# EAGLE design turns (EAGLE 7.7.0)

## Sheet 1 of 2
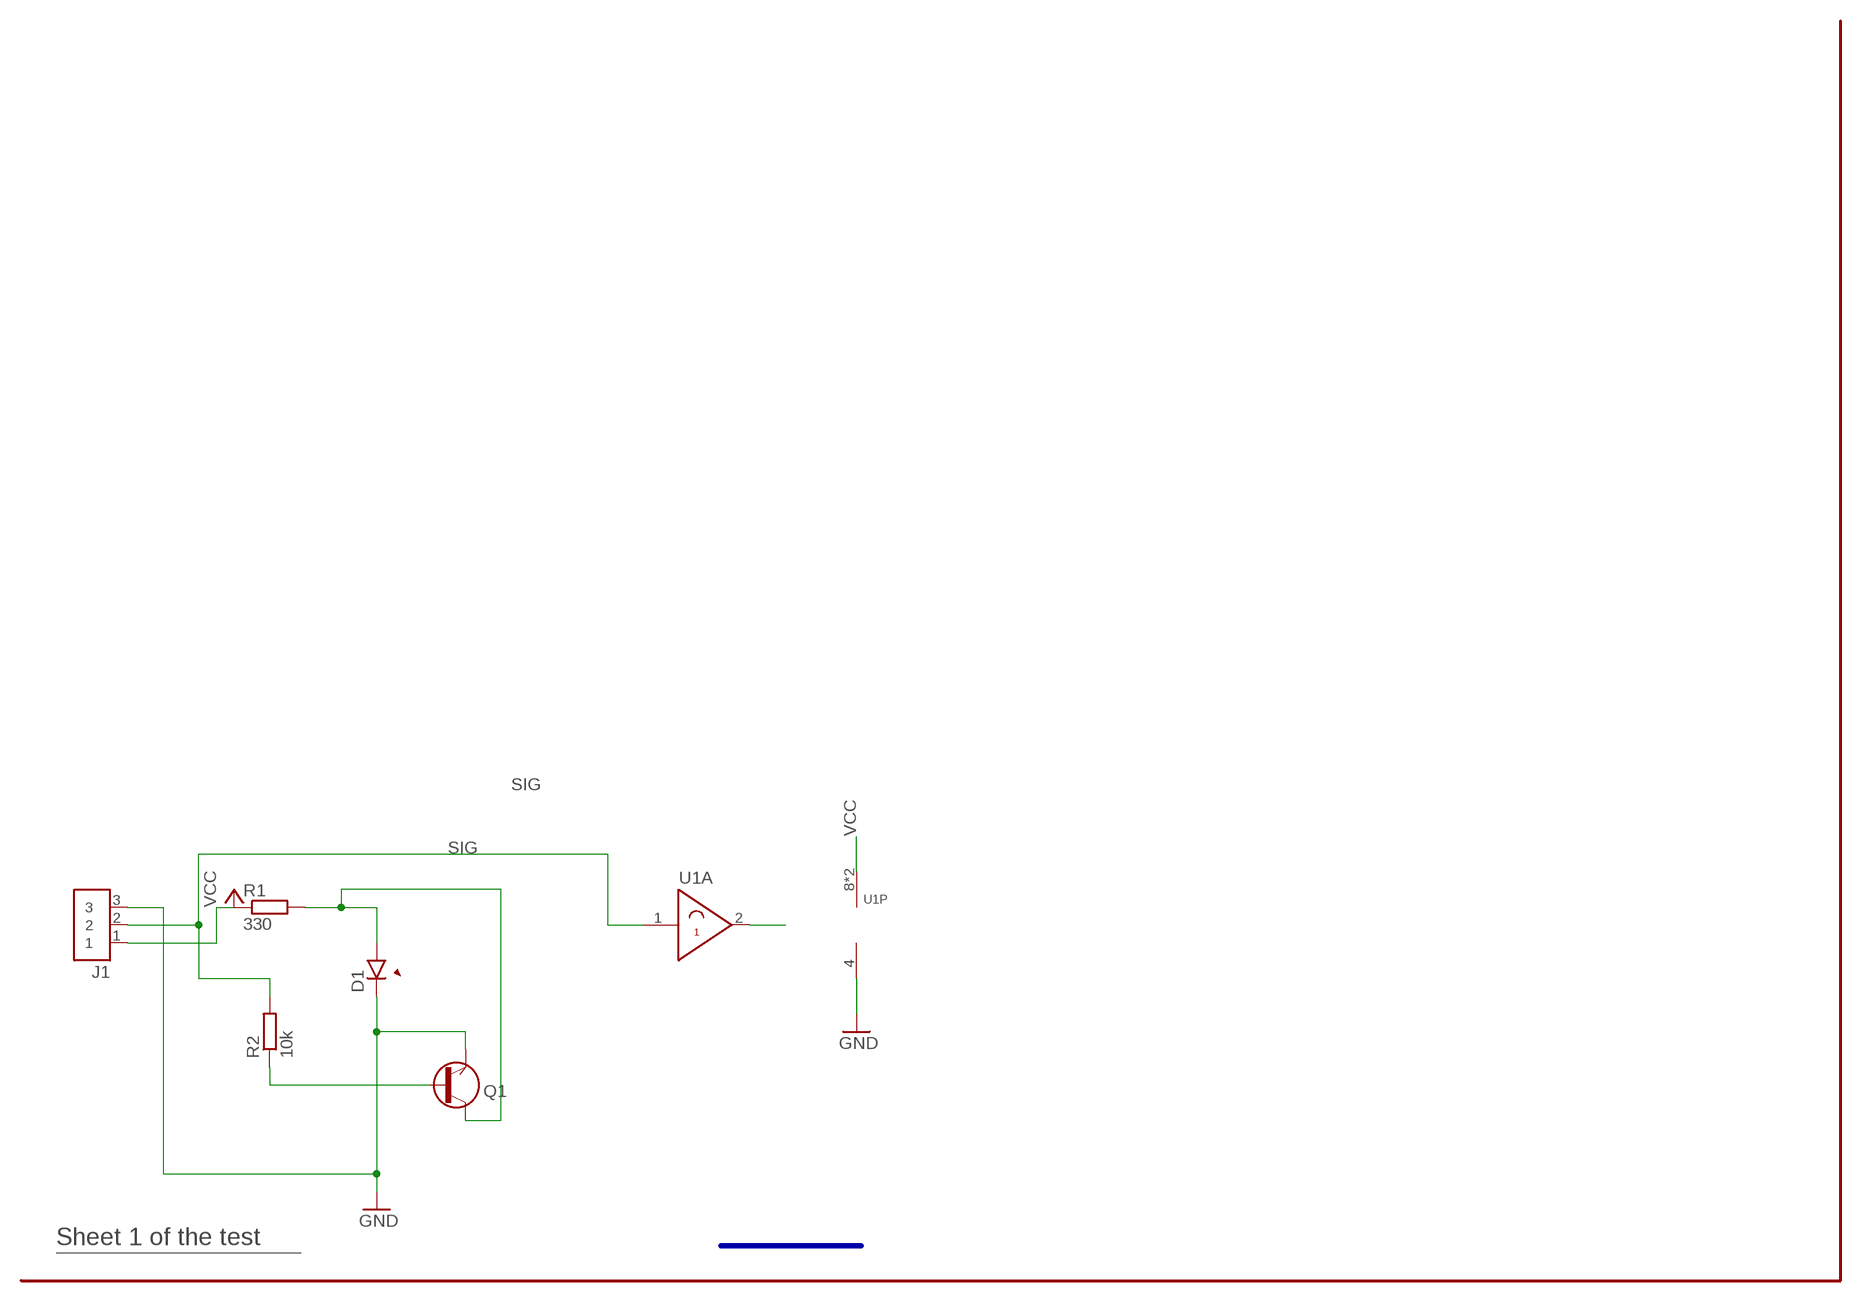
[diagram p0: schematic, sheet 1]

### Parts
D1  red  LED5MM  [LED5MM]
J1  HDR3  [HDR3]
Q1  NPN-BC817SOT23  [SOT23]
R1  330  R0805  [R0805]
R2  10k  R0805  [R0805]
U1  DUALBUFD  [SO8]

### Nets
GND [power]: D1.K(C) J1.3 Q1.2(E) U1.4(P:GND) ; also sheet 2
MID: U1.2(A:OUT) ; also sheet 2
N$1: D1.A Q1.3(C) R1.2
N$2: Q1.1(B) R2.1
SIG: J1.2 R2.2 U1.1(A:IN)
VCC [power]: J1.1 R1.1 U1.7(P:VCC) U1.8(P:VCC)

### Buses
B$1

### Notes on the sheet
- Sheet 1 of the test

## Sheet 2 of 2: Second half
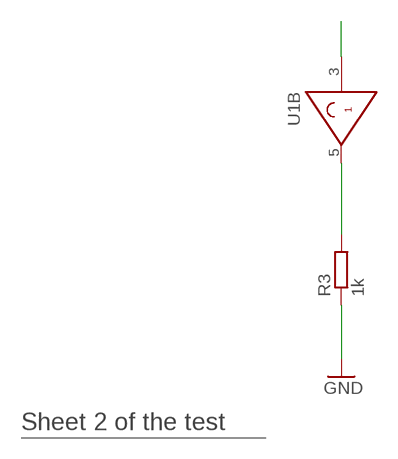
[diagram p1: schematic, sheet 2]

### Parts
R3  1k  R0805  [R0805]

### Nets
GND [power]: R3.1 ; also sheet 1
MID: U1.3(B:IN) ; also sheet 1
OUT: R3.2 U1.5(B:OUT)

### Notes on the sheet
- Sheet 2 of the test

## Library data of the parts
D1 = test:LED
J1 = test:HDR3
Q1 = test:NPN-*
R1-R3 = test:R: Resistor; MPN: RC0805FR-0710KL
U1 = test:DUALBUF: Two buffers in one package

## Net classes
0 default: width 0.254 mm
1 power: width 0.5 mm, drill 0.4 mm, clearance 0.3 mm

## Board
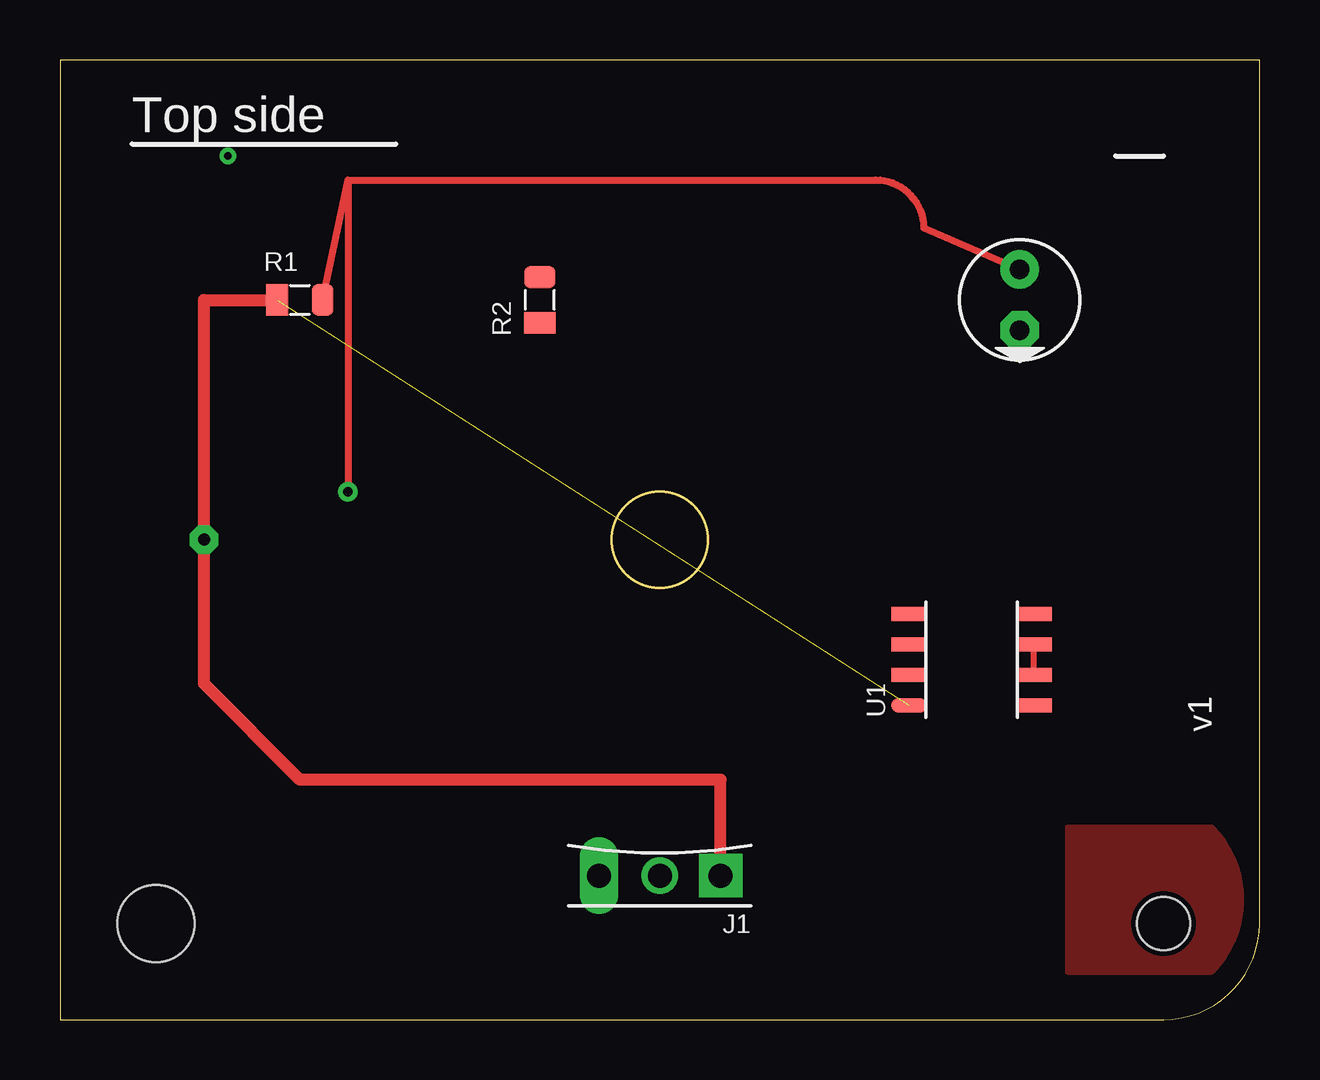
[diagram p2: board, top side]
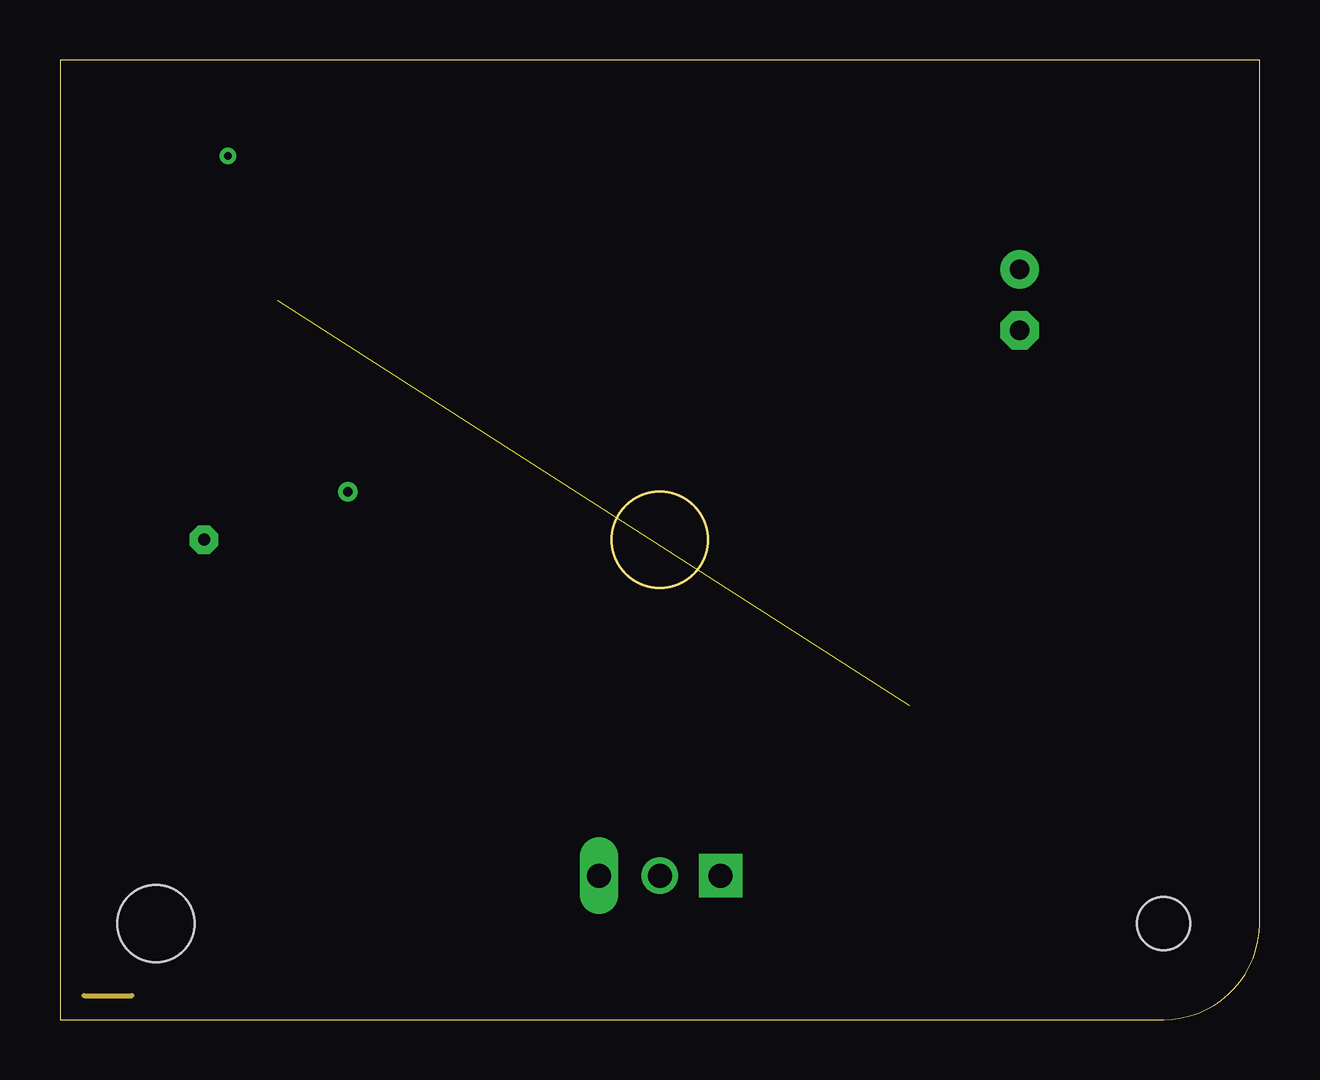
[diagram p3: board, inner layer 2]
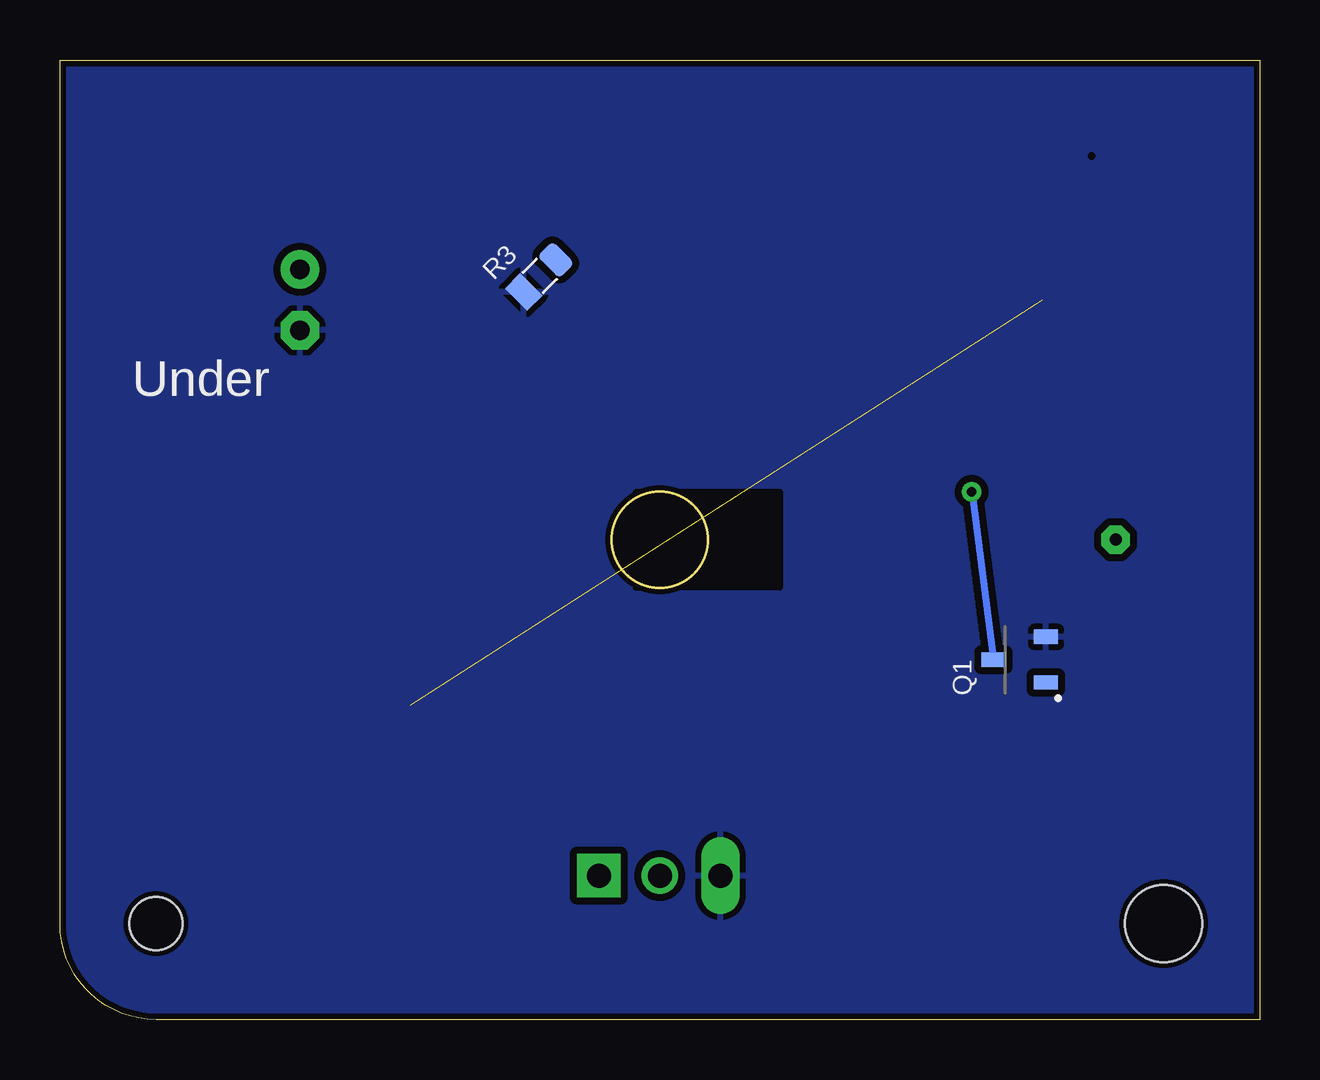
[diagram p4: board, bottom side, seen from below]

Size 50 x 40 mm. Coordinates in mm from the lower left corner, seen from the top.
Outline: 0,0 46,0 arc90 50,4 50,40 0,40 0,0
Outline: circle at 25,20 radius 2
Copper layers used: Top, layer 2, Bottom
Design rules "test": minimum track width 6mil, minimum drill 0.35mm, track to track 7mil, copper to edge 10mil, minimum pad ring 10mil, minimum via ring 8mil
Holes 2.2 mm at 46,4
layer 39: area 14,24 to 18,27
layer 41: area 30,2 to 36,6

### Footprints (pad centres in the part's own frame; a part is rotated, then mirrored left to right if it is on the bottom)
LED5MM = drill 0.8 pad 1.6: A -1.27,0 | drill 0.8 pad 1.6 octagon: K 1.27,0
HOLE3 = hole 3.2: 0,0
HDR3 = drill 1 pad 1.8 square: 1 -2.54,0 | drill 1: 2 0,0 | drill 1 pad 1.6 long: 3 2.54,0
SOT23 = smd 0.6 x 1: 1 -0.95,-1.1; 2 0.95,-1.1; 3 0,1.1
R0805 = smd 0.9 x 1.3: 1 -0.95,0; 2 0.95,0
SO8 = smd 0.6 x 1.5: 1 -1.905,-2.6; 2 -0.635,-2.6; 3 0.635,-2.6; 4 1.905,-2.6; 5 1.905,2.6; 6 0.635,2.6; 7 -0.635,2.6; 8 -1.905,2.6

### Placement (x,y rotation side)
D1  40,30 270 top
H1  [HOLE3]  4,4 0 top
J1  25,6 180 top
LOGO1  [LOGO]  45,36 0 top
Q1  10,15 90 bottom
R1  10,30 0 top
R2  20,30 90 top
R3  30,31 45 bottom
U1  38,15 90 top

### Tracks (layer width: path | path; a pad name or v marks a point on that pad's centre or on a via)
GND
  layer 2 0.2: 1,1 3,1
  pour Bottom (rank 2): 0,0 50,0 50,40 0,40
  pour Top (no thermals): 42,2 48,2 arc90 48,8 42,8
  cutout Bottom: 20,18 26,18 26,22 20,22
MID
  Top 0.254: U1.2 U1.3
N$1  (via drill 0.4)
  Top 0.3: R1.2 12,35 | 12,35 34,35 arc-90 36,33 D1.A | 12,35 v12,22
  Bottom 0.3: v12,22 Q1.3
VCC  (via drill 0.3 layers 1-2, 0.5 pad 1.2)  (1 unrouted)
  Top 0.5: J1.1 27.54,10 10,10 6,14 6,30 R1.1
  other vias: 6,20 7,36

### Text on the board
tPlace: Top side | v1
layer 22: Under